# Altium project Skipper.PrjPcb (part 2 of 2)

## Sheet Power_Supply.SchDoc: Skipper Power Supply
size 297 x 210 mm; Author: Jack Herron; SheetNumber: 10; SheetTotal: 11
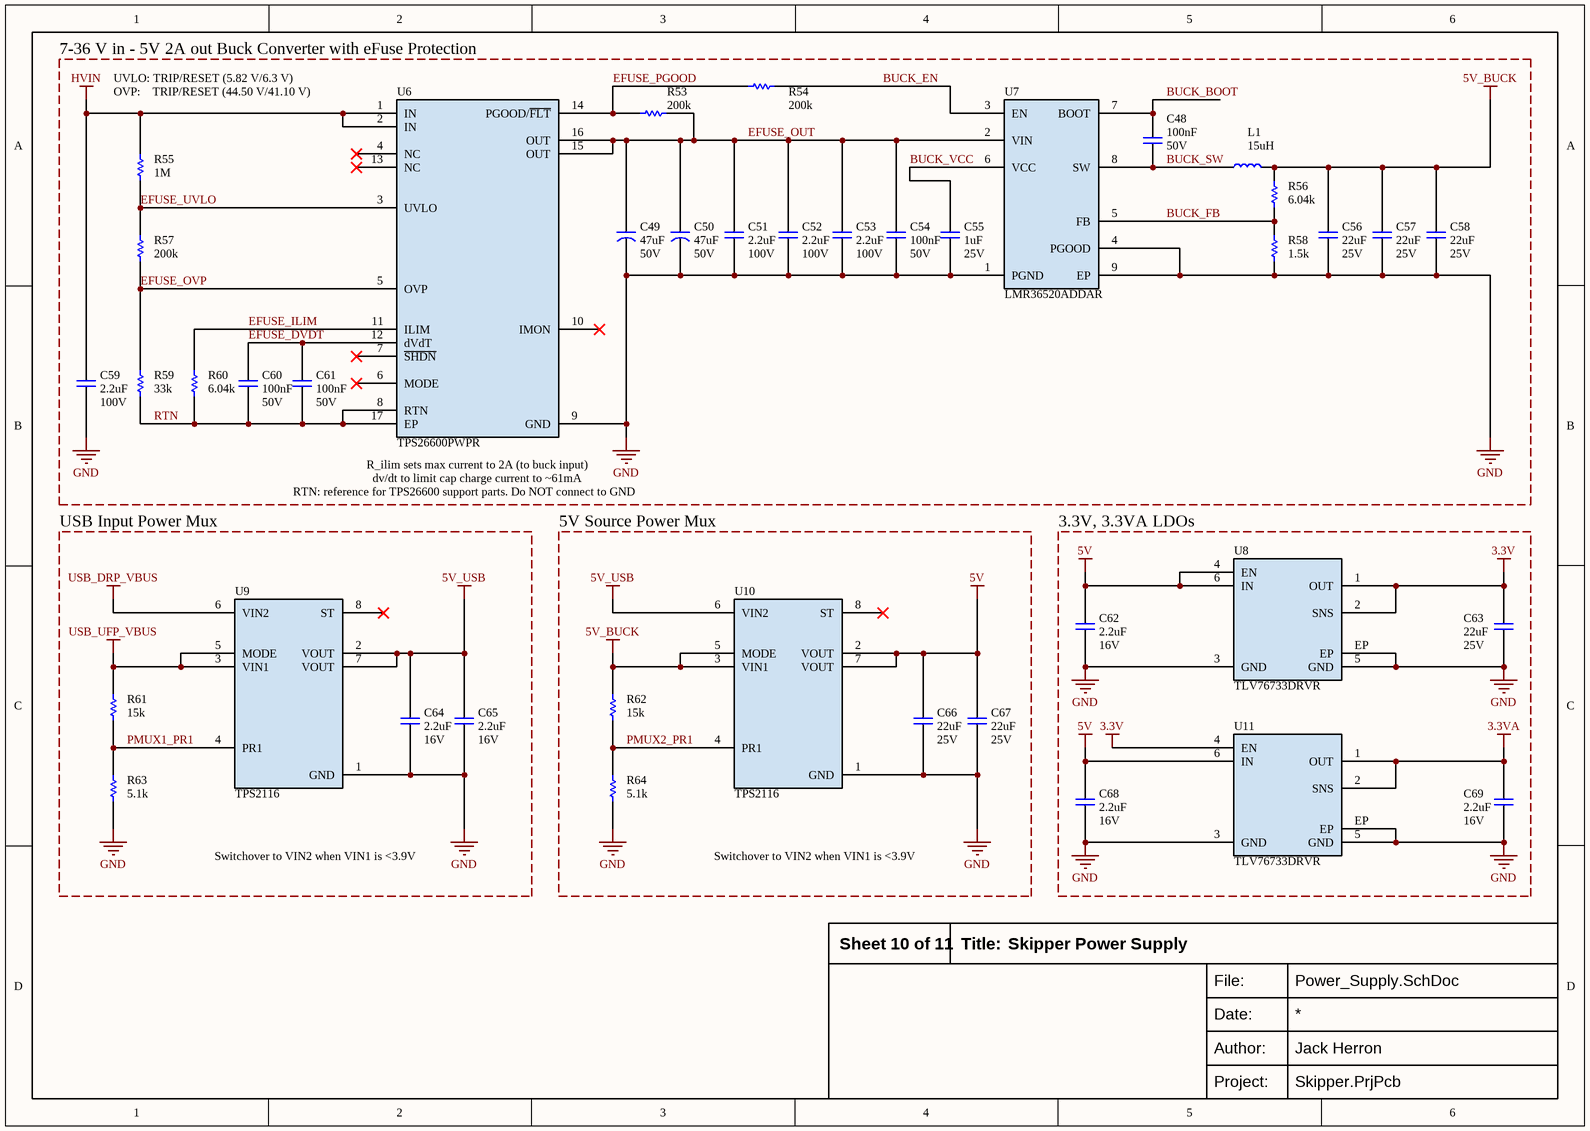
[diagram p8: Power_Supply.SchDoc]

### Parts
C48  value 100nF  Voltage: 50V  [CAPACITOR-0402]  (hidden comment: CL05B104KB54PNC)
C49  value 47uF  Voltage: 50V  [CAPACITOR_6.3x7.7]  (hidden comment: EMLA500ARA470MF80G)
C50  value 47uF  Voltage: 50V  [CAPACITOR_6.3x7.7]  (hidden comment: EMLA500ARA470MF80G)
C51  value 2.2uF  Voltage: 100V  [CAPACITOR-1206]  (hidden comment: CC1206KKX7R0BB225)
C52  value 2.2uF  Voltage: 100V  [CAPACITOR-1206]  (hidden comment: CC1206KKX7R0BB225)
C53  value 2.2uF  Voltage: 100V  [CAPACITOR-1206]  (hidden comment: CC1206KKX7R0BB225)
C54  value 100nF  Voltage: 50V  [CAPACITOR-0402]  (hidden comment: CL05B104KB54PNC)
C55  value 1uF  Voltage: 25V  [CAPACITOR-0402]  (hidden comment: CL05A105KA5NQNC)
C56  value 22uF  Voltage: 25V  [CAPACITOR-1206]  (hidden comment: CL31A226KAHNNNE)
C57  value 22uF  Voltage: 25V  [CAPACITOR-1206]  (hidden comment: CL31A226KAHNNNE)
C58  value 22uF  Voltage: 25V  [CAPACITOR-1206]  (hidden comment: CL31A226KAHNNNE)
C59  value 2.2uF  Voltage: 100V  [CAPACITOR-1206]  (hidden comment: CC1206KKX7R0BB225)
C60  value 100nF  Voltage: 50V  [CAPACITOR-0402]  (hidden comment: CL05B104KB54PNC)
C61  value 100nF  Voltage: 50V  [CAPACITOR-0402]  (hidden comment: CL05B104KB54PNC)
C62  value 2.2uF  Voltage: 16V  [CAPACITOR-0603]  (hidden comment: CL10A225KO8NNNC)
C63  value 22uF  Voltage: 25V  [CAPACITOR-1206]  (hidden comment: CL31A226KAHNNNE)
C64  value 2.2uF  Voltage: 16V  [CAPACITOR-0603]  (hidden comment: CL10A225KO8NNNC)
C65  value 2.2uF  Voltage: 16V  [CAPACITOR-0603]  (hidden comment: CL10A225KO8NNNC)
C66  value 22uF  Voltage: 25V  [CAPACITOR-1206]  (hidden comment: CL31A226KAHNNNE)
C67  value 22uF  Voltage: 25V  [CAPACITOR-1206]  (hidden comment: CL31A226KAHNNNE)
C68  value 2.2uF  Voltage: 16V  [CAPACITOR-0603]  (hidden comment: CL10A225KO8NNNC)
C69  value 2.2uF  Voltage: 16V  [CAPACITOR-0603]  (hidden comment: CL10A225KO8NNNC)
L1  value 15uH  [INDUCTOR_ASPI-0630LR]  (hidden comment: ASPI-0630LR-150M-T15)
R53  value 200k  [RESISTOR-0402]  (hidden comment: 0402WGF2003TCE)
R54  value 200k  [RESISTOR-0402]  (hidden comment: 0402WGF2003TCE)
R55  value 1M  [RESISTOR-0402]  (hidden comment: 0402WGF1004TCE)
R56  value 6.04k  [RESISTOR-0402]  (hidden comment: RC0402FR-076K04L)
R57  value 200k  [RESISTOR-0402]  (hidden comment: 0402WGF2003TCE)
R58  value 1.5k  [RESISTOR-0402]  (hidden comment: 0402WGF1501TCE)
R59  value 33k  [RESISTOR-0402]  (hidden comment: 0402WGF3302TCE)
R60  value 6.04k  [RESISTOR-0402]  (hidden comment: RC0402FR-076K04L)
R61  value 15k  [RESISTOR-0402]  (hidden comment: 0402WGF1502TCE)
R62  value 15k  [RESISTOR-0402]  (hidden comment: 0402WGF1502TCE)
R63  value 5.1k  [RESISTOR-0402]  (hidden comment: 0402WGF5101TCE)
R64  value 5.1k  [RESISTOR-0402]  (hidden comment: 0402WGF5101TCE)
U6  TPS26600PWPR  [TSSOP-16-EP-4.4]
U7  LMR36520ADDAR  [SOIC-8-EP-3.9]
U8  TLV76733DRVR  [WSON-6-2x2]
U9  TPS2116  [SOT-5X3-8]
U10  TPS2116  [SOT-5X3-8]
U11  TLV76733DRVR  [WSON-6-2x2]

### Blocks framed on the sheet
7-36 V in - 5V 2A out Buck Converter with eFuse Protection: C48-C61 L1 R53-R60 U6 U7
USB Input Power Mux: C64 C65 R61 R63 U9
5V Source Power Mux: C66 C67 R62 R64 U10
3.3V, 3.3VA LDOs: C62 C63 C68 C69 U8 U11

### Nets
3.3V: C63.2 U8.1(OUT) U8.2(SNS) U11.4(EN)
3.3VA: C69.2 U11.1(OUT) U11.2(SNS)
5V: C62.2 C66.2 C67.2 C68.2 U8.4(EN) U8.6(IN) U10.2(VOUT) U10.7(VOUT) U11.6(IN)
5V_BUCK: C56.2 C57.2 C58.2 L1.2 R56.2 R62.2 U10.3(VIN1) U10.5(MODE)
5V_USB: C64.2 C65.2 U9.2(VOUT) U9.7(VOUT) U10.6(VIN2)
GND: C49.K C50.K C51.1 C52.1 C53.1 C54.1 C55.1 C56.1 C57.1 C58.1 C59.1 C62.1 C63.1 C64.1 C65.1 C66.1 C67.1 C68.1 C69.1 R58.1 R63.1 R64.1 U6.9(GND) U7.1(PGND) U7.4(PGOOD) U7.9(EP) U8.3(GND) U8.5(GND) U8.EP U9.1(GND) U10.1(GND) U11.3(GND) U11.5(GND) U11.EP
HVIN: C59.2 R55.2 U6.1(IN) U6.2(IN)
USB_DRP_VBUS: U9.6(VIN2)
USB_UFP_VBUS: R61.2 U9.3(VIN1) U9.5(MODE)
BUCK_BOOT: C48.2 U7.7(BOOT)  [project net BUCK_BOOT_10]
BUCK_EN: R54.1 U7.3(EN)  [project net BUCK_EN_10]
BUCK_FB: R56.1 R58.2 U7.5(FB)  [project net BUCK_FB_10]
BUCK_SW: C48.1 L1.1 U7.8(SW)  [project net BUCK_SW_10]
BUCK_VCC: C55.2 U7.6(VCC)  [project net BUCK_VCC_10]
EFUSE_DVDT: C60.2 C61.2 U6.12(dVdT)  [project net EFUSE_DVDT_10]
EFUSE_ILIM: R60.2 U6.11(ILIM)  [project net EFUSE_ILIM_10]
EFUSE_OUT: C49.A C50.A C51.2 C52.2 C53.2 C54.2 R53.1 U6.15(OUT) U6.16(OUT) U7.2(VIN)  [project net EFUSE_OUT_10]
EFUSE_OVP: R57.1 R59.2 U6.5(OVP)  [project net EFUSE_OVP_10]
EFUSE_PGOOD: R53.2 R54.2 U6.14(PGOOD/~{FLT})  [project net EFUSE_PGOOD_10]
EFUSE_UVLO: R55.1 R57.2 U6.3(UVLO)  [project net EFUSE_UVLO_10]
PMUX1_PR1: R61.1 R63.2 U9.4(PR1)  [project net PMUX1_PR1_10]
PMUX2_PR1: R62.1 R64.2 U10.4(PR1)  [project net PMUX2_PR1_10]
RTN: C60.1 C61.1 R59.1 R60.1 U6.8(RTN) U6.17(EP)  [project net RTN_10]

Not connected (* = marked no-connect by the designer): U6 4(NC)* 6(MODE)* 7(~{SHDN})* 10(IMON)* 13(NC)*; U9 8(ST)*; U10 8(ST)*

### Notes on the sheet
- UVLO: TRIP/RESET (5.82 V/6.3 V)
- OVP:    TRIP/RESET (44.50 V/41.10 V)
- (near U6) dv/dt to limit cap charge current to ~61mA
- (near U6) R_ilim sets max current to 2A (to buck input)
- RTN: reference for TPS26600 support parts. Do NOT connect to GND
- Switchover to VIN2 when VIN1 is <3.9V
- Title:
- File:
- Date:
- Project:
- Author:

### Library data of the parts
C48 C54 C60 C61 = CAPACITOR_CL05B104KB54PNC: Capacitor - 100nF - 50V - 0402 - X7R; Manufacturer 1: Samsung; Manufacturer Part Number 1: CL05B104KB54PNC; Supplier 1: LCSC; Supplier Part Number 1: C307331
C49 C50 = CAPACITOR_EMLA500ARA470MF80G: Capacitor - 47uF - 50V; Manufacturer 1: NCC(Nippon Chemi-Con); Supplier 1: LCSC; Supplier Part Number 1: C2972709; Manufacturer Part Number 1: EMLA500ARA470MF80G
C51-C53 C59 = CAPACITOR_CC1206KKX7R0BB225: Capacitor - 2.2uF - 100V - 1206 - X7R; Manufacturer 1: YAGEO; Manufacturer Part Number 1: CC1206KKX7R0BB225; Supplier 1: LCSC; Supplier Part Number 1: C577211
C55 = CAPACITOR_CL05A105KA5NQNC: Capacitor - 1uF - 25V - 0402 - X5R; Manufacturer 1: Samsung; Manufacturer Part Number 1: CL05A105KA5NQNC; Supplier 1: LCSC; Supplier Part Number 1: C52923
C56-C58 C63 C66 C67 = CAPACITOR_CL31A226KAHNNNE: Capacitor - 22uF - 25V - 1206; Manufacturer 1: Samsung; Manufacturer Part Number 1: CL31A226KAHNNNE; Supplier 1: LCSC; Supplier Part Number 1: C12891
C62 C64 C65 C68 C69 = CAPACITOR_CL10A225KO8NNNC: Capacitor - 2.2uF - 16V - 0603 - X5R; Manufacturer 1: Samsung; Manufacturer Part Number 1: CL10A225KO8NNNC; Supplier 1: LCSC; Supplier Part Number 1: C23630
L1 = INDUCTOR_ASPI-0630LR-150M-T15: Power inductor - 15uH - Shielded; Manufacturer 1: Abracon LLC; Manufacturer Part Number 1: ASPI-0630LR-150M-T15; Supplier 1: LCSC; Supplier Part Number 1: C5122440
R53 R54 R57 = RESISTOR_0402WGF2003TCE: Resistor - 200k - 0402; Manufacturer 1: UNI-ROYAL; Wattage: 62.5mW; Voltage: 50V; Manufacturer Part Number 1: 0402WGF2003TCE; Supplier 1: LCSC; Supplier Part Number 1: C25764
R55 = RESISTOR_0402WGF1004TCE: Resistor - 1M - 0402; Manufacturer 1: UNI-ROYAL; Voltage: 50V; Wattage: 62.5mW; Manufacturer Part Number 1: 0402WGF1004TCE; Supplier 1: LCSC; Supplier Part Number 1: C26083
R56 R60 = RESISTOR_RC0402FR-076K04L: Resistor - 6.04k - 0402; Manufacturer 1: Yageo; Voltage: 50V; Wattage: 62.5mW; Manufacturer Part Number 1: RC0402FR-076K04L; Supplier 1: LCSC; Supplier Part Number 1: C97819
R58 = RESISTOR_0402WGF1501TCE: Resistor - 1.5k - 0402; Manufacturer 1: UNI-ROYAL; Voltage: 50V; Wattage: 62.5mW; Manufacturer Part Number 1: 0402WGF1501TCE; Supplier 1: LCSC; Supplier Part Number 1: C25867
R59 = RESISTOR_0402WGF3302TCE: Resistor - 33k - 0402; Manufacturer 1: UNI-ROYAL; Voltage: 50V; Wattage: 62.5mW; Supplier 1: LCSC; Supplier Part Number 1: C25779; Manufacturer Part Number 1: 0402WGF3302TCE
R61 R62 = RESISTOR_0402WGF1502TCE: Resistor - 15k - 0402; Manufacturer 1: UNI-ROYAL; Voltage: 50V; Wattage: 62.5mW; Manufacturer Part Number 1: 0402WGF1502TCE; Supplier 1: LCSC; Supplier Part Number 1: C25756
R63 R64 = RESISTOR_0402WGF5101TCE: Resistor - 5.1k - 0402; Manufacturer 1: UNI-ROYAL; Voltage: 50V; Wattage: 62.5mW; Manufacturer Part Number 1: 0402WGF5101TCE; Supplier 1: LCSC; Supplier Part Number 1: C25905
U6 = EFUSE_TPS2660x: 150mΩ efuse - reverse blocking; Manufacturer 1: Texas Instruments; Manufacturer Part Number 1: TPS26600PWPR; Supplier 1: LCSC; Supplier Part Number 1: C544399
U7 = REGULATOR_BUCK_LMR36520: 2A syncronous buck converter; Manufacturer 1: Texas Instruments; Manufacturer Part Number 1: LMR36520ADDAR; Supplier 1: LCSC; Supplier Part Number 1: C2879422
U8 U11 = REGULATOR_Linear_3.3V_TLV76733DRVR: LDO - 16V input - 3.3V output - 1A; Manufacturer 1: Texas Instruments; Manufacturer Part Number 1: TLV76733DRVR; Supplier 1: LCSC; Supplier Part Number 1: C2848334
U9 U10 = POWER-MUX_2-Channel_TPS2116: Priority power mux - 2 Channel; Manufacturer 1: Texas Instruments; Manufacturer Part Number 1: TPS2116DRLR; Supplier 1: LCSC; Supplier Part Number 1: C3235557

## Sheet Bus_Access.SchDoc: Skipper Bus Connection
size 297 x 210 mm; Author: Jack Herron; SheetNumber: 11; SheetTotal: 11
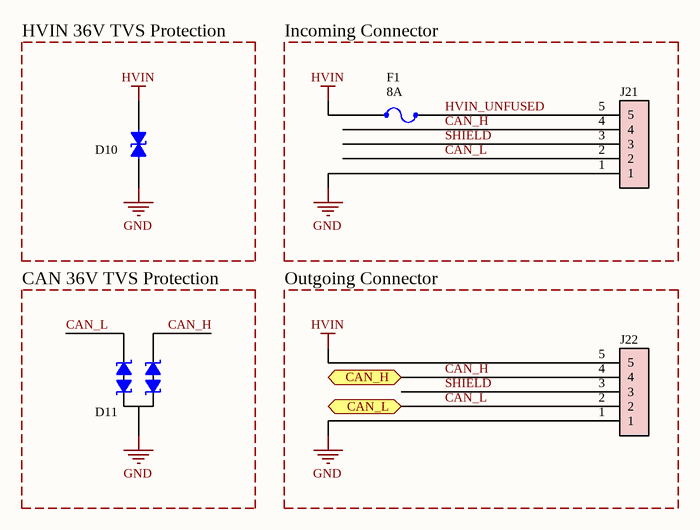
[diagram p9: Bus_Access.SchDoc]

### Parts
D10  SMBJ36CA-13-F  [DIODE-SMB_DO-214AA_BIDIRECTIONAL]  (value not drawn)
D11  PESD2CANFD36VQB-QZ  [SOT-8015]  (value not drawn)
F1  value 8A  [FUSE-1206]  (hidden comment: R12.000.8)
J21  WJ15EDGRC-3.81-05P-14-00A  [CONNECTOR_WJ15EDGRC-3.81-05P-14-00A]  (value not drawn)
J22  WJ15EDGRC-3.81-05P-14-00A  [CONNECTOR_WJ15EDGRC-3.81-05P-14-00A]  (value not drawn)

### Blocks framed on the sheet
HVIN 36V TVS Protection: D10
Incoming Connector: F1 J21
CAN 36V TVS Protection: D11
Outgoing Connector: J22

### Ports
CAN_H (bidir, see Top_Sheet[2D], CAN[5B]), CAN_L (bidir, see Top_Sheet[2D], CAN[5B])

### Nets
GND: D10.1 D11.3 J21.1 J22.1
HVIN: D10.2 F1.1 J22.5
CAN_H: D11.1 J21.4 J22.4 ; port CAN_H
CAN_L: D11.2 J21.2 J22.2 ; port CAN_L
HVIN_UNFUSED: F1.2 J21.5  [project net HVIN_UNFUSED_11]
SHIELD: J21.3 J22.3  [project net SHIELD_11]

### Notes on the sheet
- Title:
- File:
- Date:
- Project:
- Author:

### Library data of the parts
D10 = DIODE_TVS_BIDIRECTIONAL_36-46-58.1_SMBJ36CA-13-F: TVS Diode 36V standoff, 46V breakdown, 58.1V clamp; Manufacturer 1: Diodes Inc.; Manufacturer Part Number 1: SMBJ36CA-13-F; Supplier 1: LCSC; Supplier Part Number 1: C135071
D11 = ESD-ARRAY_2-Channel_PESD2CANFD36VQB-QZ: 36V standoff ESD array; Manufacturer 1: Nexperia; Manufacturer Part Number 1: PESD2CANFD36VQB-QZ; Supplier 1: LCSC; Supplier Part Number 1: C25652470
F1 = FUSE_R12.000.8: 8A 1206 Fuse; Manufacturer 1: Reomax; Manufacturer Part Number 1: R12.000.8; Supplier 1: LCSC; Supplier Part Number 1: C5383193
J21 J22 = CONNECTOR_WJ15EDGRC-3.81-05P-14-00A: 5 pin terminal block; Manufacturer 1: Ningbo Kangnex Elec; Manufacturer Part Number 1: WJ15EDGRC-3.81-05P-14-00A; Supplier 1: LCSC; Supplier Part Number 1: C8395

## Sheet Headers.SchDoc: Skipper Headers
size 297 x 210 mm; Author: Jack Herron; SheetNumber: 4; SheetTotal: 11
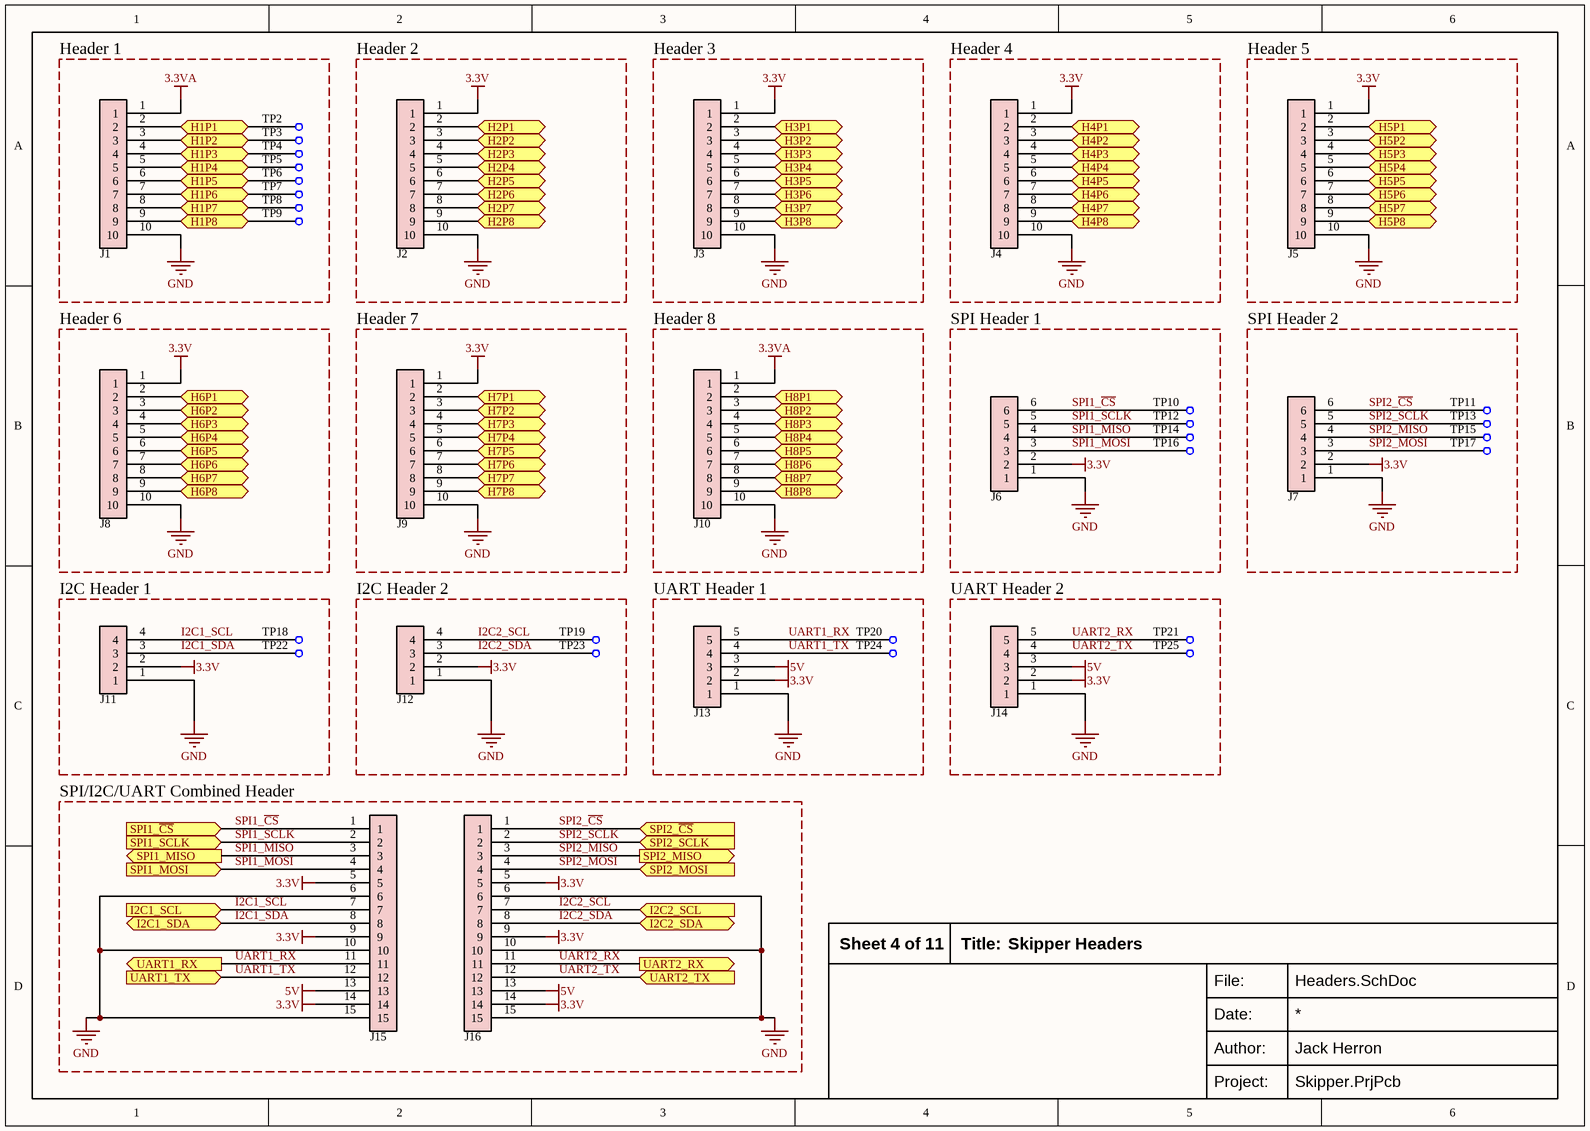
[diagram p10: Headers.SchDoc]

### Parts
J1  PM254-1-10-Z-8.5  [CONNECTOR_Female-header_1x10_2.54mm_PM254-1-10-Z-8.5_NOSILK]  (value not drawn)
J2  PM254-1-10-Z-8.5  [CONNECTOR_Female-header_1x10_2.54mm_PM254-1-10-Z-8.5_NOSILK]  (value not drawn)
J3  PM254-1-10-Z-8.5  [CONNECTOR_Female-header_1x10_2.54mm_PM254-1-10-Z-8.5_NOSILK]  (value not drawn)
J4  PM254-1-10-Z-8.5  [CONNECTOR_Female-header_1x10_2.54mm_PM254-1-10-Z-8.5_NOSILK]  (value not drawn)
J5  PM254-1-10-Z-8.5  [CONNECTOR_Female-header_1x10_2.54mm_PM254-1-10-Z-8.5_NOSILK]  (value not drawn)
J6  Connector - 6pin - 1mm  [CONNECTOR_HC-1.0-6PLT]  (value not drawn)
J7  Connector - 6pin - 1mm  [CONNECTOR_HC-1.0-6PLT]  (value not drawn)
J8  PM254-1-10-Z-8.5  [CONNECTOR_Female-header_1x10_2.54mm_PM254-1-10-Z-8.5_NOSILK]  (value not drawn)
J9  PM254-1-10-Z-8.5  [CONNECTOR_Female-header_1x10_2.54mm_PM254-1-10-Z-8.5_NOSILK]  (value not drawn)
J10  PM254-1-10-Z-8.5  [CONNECTOR_Female-header_1x10_2.54mm_PM254-1-10-Z-8.5_NOSILK]  (value not drawn)
J11  Connector - 4pin - 1mm  [CONNECTOR_HC-1.0-4PLT]  (value not drawn)
J12  Connector - 4pin - 1mm  [CONNECTOR_HC-1.0-4PLT]  (value not drawn)
J13  Connector - 5pin - 1mm  [CONNECTOR_HC-1.0-5PLT]  (value not drawn)
J14  Connector - 5pin - 1mm  [CONNECTOR_HC-1.0-5PLT]  (value not drawn)
J15  PM254-1-15-Z-8.5  [CONNECTOR_PM254-1-15-Z-8.5]  (value not drawn)
J16  PM254-1-15-Z-8.5  [CONNECTOR_PM254-1-15-Z-8.5]  (value not drawn)
TP2  RH-5019  [TESTPOINT_RH-5019]  (value not drawn)
TP3  RH-5019  [TESTPOINT_RH-5019]  (value not drawn)
TP4  RH-5019  [TESTPOINT_RH-5019]  (value not drawn)
TP5  RH-5019  [TESTPOINT_RH-5019]  (value not drawn)
TP6  RH-5019  [TESTPOINT_RH-5019]  (value not drawn)
TP7  RH-5019  [TESTPOINT_RH-5019]  (value not drawn)
TP8  RH-5019  [TESTPOINT_RH-5019]  (value not drawn)
TP9  RH-5019  [TESTPOINT_RH-5019]  (value not drawn)
TP10  RH-5019  [TESTPOINT_RH-5019]  (value not drawn)
TP11  RH-5019  [TESTPOINT_RH-5019]  (value not drawn)
TP12  RH-5019  [TESTPOINT_RH-5019]  (value not drawn)
TP13  RH-5019  [TESTPOINT_RH-5019]  (value not drawn)
TP14  RH-5019  [TESTPOINT_RH-5019]  (value not drawn)
TP15  RH-5019  [TESTPOINT_RH-5019]  (value not drawn)
TP16  RH-5019  [TESTPOINT_RH-5019]  (value not drawn)
TP17  RH-5019  [TESTPOINT_RH-5019]  (value not drawn)
TP18  RH-5019  [TESTPOINT_RH-5019]  (value not drawn)
TP19  RH-5019  [TESTPOINT_RH-5019]  (value not drawn)
TP20  RH-5019  [TESTPOINT_RH-5019]  (value not drawn)
TP21  RH-5019  [TESTPOINT_RH-5019]  (value not drawn)
TP22  RH-5019  [TESTPOINT_RH-5019]  (value not drawn)
TP23  RH-5019  [TESTPOINT_RH-5019]  (value not drawn)
TP24  RH-5019  [TESTPOINT_RH-5019]  (value not drawn)
TP25  RH-5019  [TESTPOINT_RH-5019]  (value not drawn)

### Blocks framed on the sheet
Header 1: J1 TP2-TP9
Header 2: J2
Header 3: J3
Header 4: J4
Header 5: J5
Header 6: J8
Header 7: J9
Header 8: J10
SPI Header 1: J6 TP10 TP12 TP14 TP16
SPI Header 2: J7 TP11 TP13 TP15 TP17
I2C Header 1: J11 TP18 TP22
I2C Header 2: J12 TP19 TP23
UART Header 1: J13 TP20 TP24
UART Header 2: J14 TP21 TP25
SPI/I2C/UART Combined Header: J15 J16

### Ports
H1P1 (bidir, see Top_Sheet[2A]), H1P2 (bidir, see Top_Sheet[2A]), H1P3 (bidir, see Top_Sheet[2A]), H1P4 (bidir, see Top_Sheet[3A]), H1P5 (bidir, see Top_Sheet[3A]), H1P6 (bidir, see Top_Sheet[3A]), H1P7 (bidir, see Top_Sheet[3A]), H1P8 (bidir, see Top_Sheet[3A]), H2P1 (bidir, see Top_Sheet[3A]), H2P2 (bidir, see Top_Sheet[3A]), H2P3 (bidir, see Top_Sheet[3A]), H2P4 (bidir, see Top_Sheet[3A]), H2P5 (bidir, see Top_Sheet[3A]), H2P6 (bidir, see Top_Sheet[3A]), H2P7 (bidir, see Top_Sheet[3A]), H2P8 (bidir, see Top_Sheet[3A]), H3P1 (bidir, see Top_Sheet[3A]), H3P2 (bidir, see Top_Sheet[3A]), H3P3 (bidir, see Top_Sheet[3A]), H3P4 (bidir, see Top_Sheet[3A]), H3P5 (bidir, see Top_Sheet[3A]), H3P6 (bidir, see Top_Sheet[4A]), H3P7 (bidir, see Top_Sheet[4A]), H3P8 (bidir, see Top_Sheet[4A]), H4P1 (bidir, see Top_Sheet[4A]), H4P2 (bidir, see Top_Sheet[4A]), H4P3 (bidir, see Top_Sheet[4A]), H4P4 (bidir, see Top_Sheet[4A]), H4P5 (bidir, see Top_Sheet[4A]), H4P6 (bidir, see Top_Sheet[4A]), H4P7 (bidir, see Top_Sheet[4A]), H4P8 (bidir, see Top_Sheet[4A]), H5P1 (bidir, see Top_Sheet[4A]), H5P2 (bidir, see Top_Sheet[4A]), H5P3 (bidir, see Top_Sheet[4A]), H5P4 (bidir, see Top_Sheet[4A]), H5P5 (bidir, see Top_Sheet[4A]), H5P6 (bidir, see Top_Sheet[4A]), H5P7 (bidir, see Top_Sheet[5A]), H5P8 (bidir, see Top_Sheet[5A]), H6P1 (bidir, see Top_Sheet[5A]), H6P2 (bidir, see Top_Sheet[5A]), H6P3 (bidir, see Top_Sheet[5A]), H6P4 (bidir, see Top_Sheet[5A]), H6P5 (bidir, see Top_Sheet[5A]), H6P6 (bidir, see Top_Sheet[5A]), H6P7 (bidir, see Top_Sheet[5A]), H6P8 (bidir, see Top_Sheet[5A]), H7P1 (bidir, see Top_Sheet[5A]), H7P2 (bidir, see Top_Sheet[5A]), H7P3 (bidir, see Top_Sheet[5A]), H7P4 (bidir, see Top_Sheet[5A]), H7P5 (bidir, see Top_Sheet[5A]), H7P6 (bidir, see Top_Sheet[5A]), H7P7 (bidir, see Top_Sheet[5A]), H7P8 (bidir, see Top_Sheet[5A]), H8P1 (bidir, see Top_Sheet[6A]), H8P2 (bidir, see Top_Sheet[6A]), H8P3 (bidir, see Top_Sheet[6A]), H8P4 (bidir, see Top_Sheet[6A]), H8P5 (bidir, see Top_Sheet[6A]), H8P6 (bidir, see Top_Sheet[6A]), H8P7 (bidir, see Top_Sheet[6A]), H8P8 (bidir, see Top_Sheet[6A]), I2C1_SCL (in, see Top_Sheet[1A], MCU_IO[4D]), I2C1_SDA (bidir, see Top_Sheet[1A], MCU_IO[4D]), I2C2_SCL (in, see Top_Sheet[1A], MCU_IO[6D]), I2C2_SDA (bidir, see Top_Sheet[1A], MCU_IO[6D]), SPI1_MISO (out, see Top_Sheet[2A], MCU_IO[3C]), SPI1_MOSI (in, see Top_Sheet[2A], MCU_IO[1C]), SPI1_SCLK (in, see Top_Sheet[2A], MCU_IO[3C]), SPI1_~{CS} (in, see Top_Sheet[2A], MCU_IO[6A]), SPI2_MISO (out, see Top_Sheet[2A], MCU_IO[1B]), SPI2_MOSI (in, see Top_Sheet[2A], MCU_IO[1B]), SPI2_SCLK (in, see Top_Sheet[2A], MCU_IO[1B]), SPI2_~{CS} (in, see Top_Sheet[2A], MCU_IO[6B]), UART1_RX (out, see Top_Sheet[2A], MCU_IO[1A]), UART1_TX (in, see Top_Sheet[2A], MCU_IO[1A]), UART2_RX (out, see Top_Sheet[2A], MCU_IO[1C]), UART2_TX (in, see Top_Sheet[2A], MCU_IO[1C])

### Nets
3.3V: J2.1 J3.1 J4.1 J5.1 J6.2 J7.2 J8.1 J9.1 J11.2 J12.2 J13.2 J14.2 J15.5 J15.9 J15.14 J16.5 J16.9 J16.14
3.3VA: J1.1 J10.1
5V: J13.3 J14.3 J15.13 J16.13
GND: J1.10 J2.10 J3.10 J4.10 J5.10 J6.1 J7.1 J8.10 J9.10 J10.10 J11.1 J12.1 J13.1 J14.1 J15.6 J15.10 J15.15 J16.6 J16.10 J16.15
I2C1_SCL: J11.4 J15.7 TP18.1 ; port I2C1_SCL
I2C1_SDA: J11.3 J15.8 TP22.1 ; port I2C1_SDA
I2C2_SCL: J12.4 J16.7 TP19.1 ; port I2C2_SCL
I2C2_SDA: J12.3 J16.8 TP23.1 ; port I2C2_SDA
PA0: J1.6 TP6.1 ; port H1P5
PA1: J1.5 TP5.1 ; port H1P4
PA2: J1.4 TP4.1 ; port H1P3
PA3: J1.3 TP3.1 ; port H1P2
PA4: J1.2 TP2.1 ; port H1P1
PA5: J10.9 ; port H8P8
PA6: J10.8 ; port H8P7
PA7: J10.7 ; port H8P6
PA15: J5.4 ; port H5P3
PB0: J10.4 ; port H8P3
PB1: J10.3 ; port H8P2
PB2: J2.2 ; port H2P1
PB4: J4.5 ; port H4P4
PB5: J4.4 ; port H4P3
PB6: J4.3 ; port H4P2
PB7: J4.2 ; port H4P1
PB10: J8.8 ; port H6P7
PC0: J10.2 ; port H8P1
PC1: J1.9 TP9.1 ; port H1P8
PC2: J1.8 TP8.1 ; port H1P7
PC3: J1.7 TP7.1 ; port H1P6
PC4: J10.6 ; port H8P5
PC5: J10.5 ; port H8P4
PC6: J5.6 ; port H5P5
PC7: J5.5 ; port H5P4
PD3: J5.3 ; port H5P2
PD4: J5.2 ; port H5P1
PD10: J8.7 ; port H6P6
PD11: J8.6 ; port H6P5
PD12: J8.5 ; port H6P4
PD13/LED: J8.4 ; port H6P3
PD14: J8.3 ; port H6P2
PD15: J8.2 ; port H6P1
PE0: J3.2 ; port H3P1
PE2: J3.9 ; port H3P8
PE3: J3.8 ; port H3P7
PE4: J3.7 ; port H3P6
PE5: J3.6 ; port H3P5
PE6: J3.5 ; port H3P4
PE7: J9.9 ; port H7P8
PE8: J9.8 ; port H7P7
PE9: J9.7 ; port H7P6
PE10: J9.6 ; port H7P5
PE11: J9.5 ; port H7P4
PE12: J9.4 ; port H7P3
PE13: J9.3 ; port H7P2
PE14: J9.2 ; port H7P1
PE15: J8.9 ; port H6P8
PF2: J3.4 ; port H3P3
PF3: J3.3 ; port H3P2
PF4: J2.9 ; port H2P8
PF5: J2.8 ; port H2P7
PF6: J2.7 ; port H2P6
PF7: J2.6 ; port H2P5
PF8: J2.5 ; port H2P4
PF9: J2.4 ; port H2P3
PF10: J2.3 ; port H2P2
PG6: J5.9 ; port H5P8
PG7: J5.8 ; port H5P7
PG8: J5.7 ; port H5P6
PG12: J4.9 ; port H4P8
PG13: J4.8 ; port H4P7
PG14: J4.7 ; port H4P6
PG15: J4.6 ; port H4P5
SPI1_~{CS}: J6.6 J15.1 TP10.1 ; port SPI1_~{CS}
SPI1_MISO: J6.4 J15.3 TP14.1 ; port SPI1_MISO
SPI1_MOSI: J6.3 J15.4 TP16.1 ; port SPI1_MOSI
SPI1_SCLK: J6.5 J15.2 TP12.1 ; port SPI1_SCLK
SPI2_~{CS}: J7.6 J16.1 TP11.1 ; port SPI2_~{CS}
SPI2_MISO: J7.4 J16.3 TP15.1 ; port SPI2_MISO
SPI2_MOSI: J7.3 J16.4 TP17.1 ; port SPI2_MOSI
SPI2_SCLK: J7.5 J16.2 TP13.1 ; port SPI2_SCLK
UART1_RX: J13.5 J15.11 TP20.1 ; port UART1_RX
UART1_TX: J13.4 J15.12 TP24.1 ; port UART1_TX
UART2_RX: J14.5 J16.11 TP21.1 ; port UART2_RX
UART2_TX: J14.4 J16.12 TP25.1 ; port UART2_TX

### Notes on the sheet
- Title:
- File:
- Date:
- Project:
- Author:

### Library data of the parts
J1-J5 J8-J10 = CONNECTOR_Female-header_1x10_2.54mm_PM254-1-10-Z-8.5_NOSILK: Header - 1x10 - 2.54mm; Manufacturer 1: HCTL; Manufacturer Part Number 1: PM254-1-10-Z-8.5; Supplier 1: LCSC; Supplier Part Number 1: C2897373
J6 J7 = CONNECTOR_HC-1.0-6PLT: Manufacturer 1: HCTL; Manufacturer Part Number 1: HC-1.0-6PLT; Supplier 1: LCSC; Supplier Part Number 1: C2845374
J11 J12 = CONNECTOR_HC-1.0-4PLT: Manufacturer 1: HCTL; Manufacturer Part Number 1: HC-1.0-4PLT; Supplier 1: LCSC; Supplier Part Number 1: C2845372
J13 J14 = CONNECTOR_HC-1.0-5PLT: Manufacturer 1: HCTL; Manufacturer Part Number 1: HC-1.0-5PLT; Supplier 1: LCSC; Supplier Part Number 1: C2845373
J15 J16 = CONNECTOR_PM254-1-15-Z-8.5: 1x15 2.54mm Female Header; Manufacturer 1: HCTL; Manufacturer Part Number 1: PM254-1-15-Z-8.5; Supplier 1: LCSC; Supplier Part Number 1: C2897378
TP2-TP25 = TESTPOINT_RH-5019: SMD testpoint; Manufacturer 1: ronghe; Manufacturer Part Number 1: RH-5019; Supplier 1: LCSC; Supplier Part Number 1: C5199800

## Nets that join several sheets
3.3V: MCU_IO (12 pins), MCU_Core (31 pins), SDMMC (9 pins), USBC_DRP (C30.2 R28.2 R33.2 U2.12), CAN (C38.2 U4.5), DAP (19 pins), Power_Supply (C63.2 U8.1 U8.2 U11.4), Headers (18 pins)
3.3VA: MCU_Core (C22.2 C23.2 U1.32 U1.33), Power_Supply (C69.2 U11.1 U11.2), Headers (J1.1 J10.1)
5V: USBC_DRP (5 pins), CAN (C36.2 C37.2 U4.3), Power_Supply (9 pins), Headers (J13.3 J14.3 J15.13 J16.13)
5V_BUCK: MCU_IO (R10.2), Power_Supply (8 pins)
GND: MCU_IO (9 pins), MCU_Core (39 pins), SDMMC (8 pins), USBC_DRP (22 pins), USBC_UFP (13 pins), CAN (6 pins), DAP (21 pins), Power_Supply (34 pins), Bus_Access (D10.1 D11.3 J21.1 J22.1), Headers (20 pins)
HVIN: Power_Supply (C59.2 R55.2 U6.1 U6.2), Bus_Access (D10.2 F1.1 J22.5)
USB_DRP_VBUS: USBC_DRP (8 pins), Power_Supply (U9.6)
USB_UFP_VBUS: MCU_IO (R9.2), USBC_UFP (6 pins), DAP (Q1.1 R50.2), Power_Supply (R61.2 U9.3 U9.5)
CAN_H: CAN (TP30.1 U4.7), Bus_Access (D11.1 J21.4 J22.4)
CAN_L: CAN (TP31.1 U4.6), Bus_Access (D11.2 J21.2 J22.2)
DAP_D_N: USBC_UFP (D7.3 D7.4 J19.A7 J19.B7), DAP (U5.32)
DAP_D_P: USBC_UFP (D7.1 D7.6 J19.A6 J19.B6), DAP (R52.1 U5.33)
DAP_RX: MCU_Core (U1.77), DAP (U5.13)
DAP_TX: MCU_Core (U1.78), DAP (R44.1 U5.12)
FDCAN_RX: MCU_IO (U1.114), CAN (TP29.1 U4.4)
FDCAN_TX: MCU_IO (U1.115), CAN (TP28.1 U4.1)
I2C1_SCL: MCU_IO (R14.1 U1.139), Headers (J11.4 J15.7 TP18.1)
I2C1_SDA: MCU_IO (R15.1 U1.140), Headers (J11.3 J15.8 TP22.1)
I2C2_SCL: MCU_IO (R16.1 U1.11), USBC_DRP (U2.8), Headers (J12.4 J16.7 TP19.1)
I2C2_SDA: MCU_IO (R17.1 U1.10), USBC_DRP (U2.7), Headers (J12.3 J16.8 TP23.1)
NRST: MCU_Core (C24.2 R20.1 SW3.1 U1.25), DAP (U5.18)
PA0: MCU_IO (U1.34), Headers (J1.6 TP6.1)
PA1: MCU_IO (U1.35), Headers (J1.5 TP5.1)
PA2: MCU_IO (U1.36), Headers (J1.4 TP4.1)
PA3: MCU_IO (U1.37), Headers (J1.3 TP3.1)
PA4: MCU_IO (U1.40), Headers (J1.2 TP2.1)
PA5: MCU_IO (U1.41), Headers (J10.9)
PA6: MCU_IO (U1.42), Headers (J10.8)
PA7: MCU_IO (U1.43), Headers (J10.7)
PA15: MCU_IO (U1.110), Headers (J5.4)
PB0: MCU_IO (U1.46), Headers (J10.4)
PB1: MCU_IO (U1.47), Headers (J10.3)
PB2: MCU_IO (U1.48), Headers (J2.2)
PB4: MCU_IO (U1.134), Headers (J4.5)
PB5: MCU_IO (U1.135), Headers (J4.4)
PB6: MCU_IO (U1.136), Headers (J4.3)
PB7: MCU_IO (U1.137), Headers (J4.2)
PB10: MCU_IO (U1.69), Headers (J8.8)
PC0: MCU_IO (U1.26), Headers (J10.2)
PC1: MCU_IO (U1.27), Headers (J1.9 TP9.1)
PC2: MCU_IO (U1.28), Headers (J1.8 TP8.1)
PC3: MCU_IO (U1.29), Headers (J1.7 TP7.1)
PC4: MCU_IO (U1.44), Headers (J10.6)
PC5: MCU_IO (U1.45), Headers (J10.5)
PC6: MCU_IO (U1.96), Headers (J5.6)
PC7: MCU_IO (U1.97), Headers (J5.5)
PD3: MCU_IO (U1.117), Headers (J5.3)
PD4: MCU_IO (U1.118), Headers (J5.2)
PD10: MCU_IO (U1.79), Headers (J8.7)
PD11: MCU_IO (U1.80), Headers (J8.6)
PD12: MCU_IO (U1.81), Headers (J8.5)
PD13/LED: MCU_IO (R11.2 U1.82), Headers (J8.4)
PD14: MCU_IO (U1.85), Headers (J8.3)
PD15: MCU_IO (U1.86), Headers (J8.2)
PE0: MCU_IO (U1.141), Headers (J3.2)
PE2: MCU_IO (U1.1), Headers (J3.9)
PE3: MCU_IO (U1.2), Headers (J3.8)
PE4: MCU_IO (U1.3), Headers (J3.7)
PE5: MCU_IO (U1.4), Headers (J3.6)
PE6: MCU_IO (U1.5), Headers (J3.5)
PE7: MCU_IO (U1.58), Headers (J9.9)
PE8: MCU_IO (U1.59), Headers (J9.8)
PE9: MCU_IO (U1.60), Headers (J9.7)
PE10: MCU_IO (U1.63), Headers (J9.6)
PE11: MCU_IO (U1.64), Headers (J9.5)
PE12: MCU_IO (U1.65), Headers (J9.4)
PE13: MCU_IO (U1.66), Headers (J9.3)
PE14: MCU_IO (U1.67), Headers (J9.2)
PE15: MCU_IO (U1.68), Headers (J8.9)
PF2: MCU_IO (U1.12), Headers (J3.4)
PF3: MCU_IO (U1.13), Headers (J3.3)
PF4: MCU_IO (U1.14), Headers (J2.9)
PF5: MCU_IO (U1.15), Headers (J2.8)
PF6: MCU_IO (U1.18), Headers (J2.7)
PF7: MCU_IO (U1.19), Headers (J2.6)
PF8: MCU_IO (U1.20), Headers (J2.5)
PF9: MCU_IO (U1.21), Headers (J2.4)
PF10: MCU_IO (U1.22), Headers (J2.3)
PG6: MCU_IO (U1.91), Headers (J5.9)
PG7: MCU_IO (U1.92), Headers (J5.8)
PG8: MCU_IO (U1.93), Headers (J5.7)
PG12: MCU_IO (U1.127), Headers (J4.9)
PG13: MCU_IO (U1.128), Headers (J4.8)
PG14: MCU_IO (U1.129), Headers (J4.7)
PG15: MCU_IO (U1.132), Headers (J4.6)
SDMMC_CLK: MCU_IO (R18.1), SDMMC (J17.5)
SDMMC_CMD: MCU_IO (U1.116), SDMMC (J17.3 R26.1)
SDMMC_D0: MCU_IO (U1.98), SDMMC (J17.7 R22.1)
SDMMC_D1: MCU_IO (U1.99), SDMMC (J17.8 R23.1)
SDMMC_D2: MCU_IO (U1.111), SDMMC (J17.1 R24.1)
SDMMC_D3: MCU_IO (U1.112), SDMMC (J17.2 R25.1)
SDMMC_DETECT: MCU_IO (U1.49), SDMMC (J17.SWB R27.1)
SPI1_~{CS}: MCU_IO (R1.1 U1.125), Headers (J6.6 J15.1 TP10.1)
SPI1_MISO: MCU_IO (U1.124), Headers (J6.4 J15.3 TP14.1)
SPI1_MOSI: MCU_IO (U1.123), Headers (J6.3 J15.4 TP16.1)
SPI1_SCLK: MCU_IO (U1.126), Headers (J6.5 J15.2 TP12.1)
SPI2_~{CS}: MCU_IO (R8.1 U1.73), Headers (J7.6 J16.1 TP11.1)
SPI2_MISO: MCU_IO (U1.75), Headers (J7.4 J16.3 TP15.1)
SPI2_MOSI: MCU_IO (U1.76), Headers (J7.3 J16.4 TP17.1)
SPI2_SCLK: MCU_IO (U1.74), Headers (J7.5 J16.2 TP13.1)
SWCLK: MCU_Core (U1.109), DAP (U5.15 U5.26)
SWDIO: MCU_Core (U1.105), DAP (R43.1 U5.27)
SWO: MCU_Core (U1.133), DAP (U5.31)
UART1_RX: MCU_IO (U1.102), Headers (J13.5 J15.11 TP20.1)
UART1_TX: MCU_IO (U1.101), Headers (J13.4 J15.12 TP24.1)
UART2_RX: MCU_IO (U1.122), Headers (J14.5 J16.11 TP21.1)
UART2_TX: MCU_IO (U1.119), Headers (J14.4 J16.12 TP25.1)
USB_D_N: MCU_IO (U1.103), USBC_DRP (D4.4 J18.A7 J18.B7 TP26.1)
USB_D_P: MCU_IO (U1.104), USBC_DRP (D4.6 J18.A6 J18.B6 TP27.1)
USB_DRP_~{FAULT}: MCU_IO (U1.54), USBC_DRP (R33.1 U3.4)
USB_DRP_~{INT}: MCU_IO (U1.55), USBC_DRP (R28.1 U2.6)